# Altium schematic sheet Connector Section.SchDoc
size A4; DocumentNumber: 6; SheetNumber: 6; SheetTotal: 6
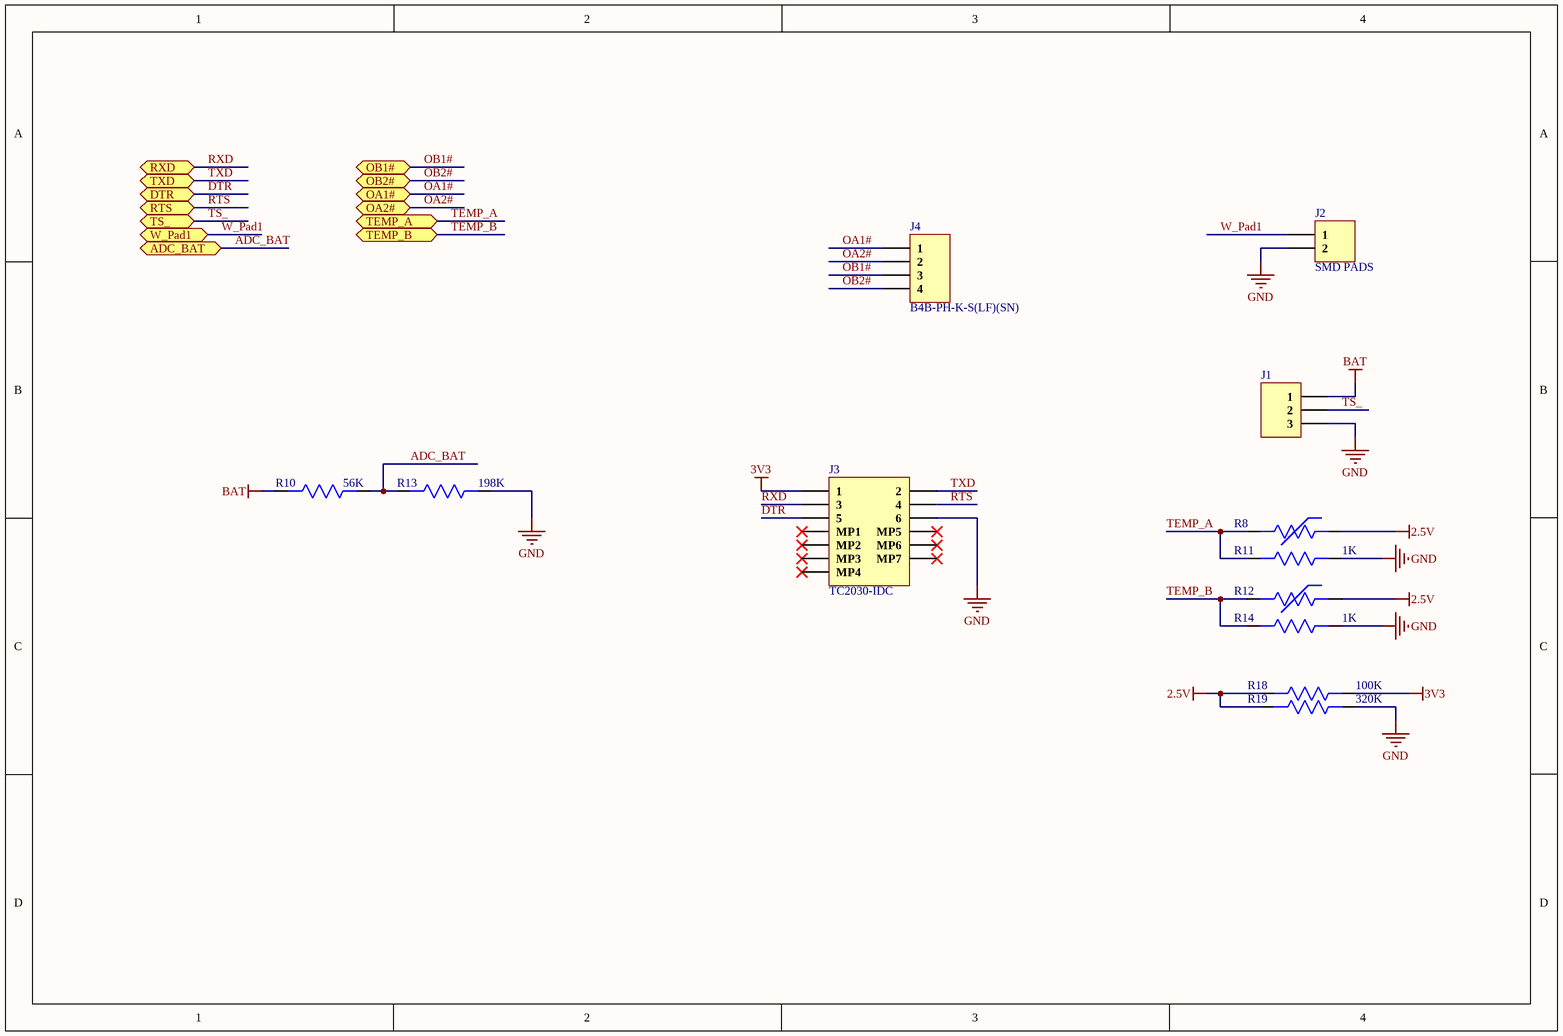
[diagram p0: Connector Section.SchDoc]

## Parts
J1  B3B-PH-K-S(LF)(SN)  [B3B-PH-K-S(LF)(SN)]  (value not drawn)
J2  SMD PADS  [SMD PAD]
J3  TC2030-IDC  [TC2030-IDC]
J4  B4B-PH-K-S(LF)(SN)  [B4B-PH-K-S(LF)(SN)]
R8  B57230V2103F260  [Res0402]  (value not drawn)
R10  56K  [Res-0201]
R11  1K  [Res-0201]
R12  B57230V2103F260  [Res0402]  (value not drawn)
R13  198K  [Res0402]
R14  1K  [Res-0201]
R18  100K  [Res-0201]
R19  320K  [Res0603]

## Ports
ADC_BAT (bidir), DTR (bidir), OA1# (bidir), OA2# (bidir), OB1# (bidir), OB2# (bidir), RTS (bidir), RXD (bidir), TEMP_A (bidir), TEMP_B (bidir), TS_ (bidir), TXD (bidir), W_Pad1 (bidir)

## Nets
2.5V: R8.1 R12.1 R18.2 R19.2
3V3: J3.1 R18.1
BAT: J1.1 R10.2
GND: J1.3 J2.2 J3.6 R11.1 R13.1 R14.1 R19.1
ADC_BAT: R10.1 R13.2 ; port ADC_BAT
DTR: J3.5 ; port DTR
OA1#: J4.1 ; port OA1#
OA2#: J4.2 ; port OA2#
OB1#: J4.3 ; port OB1#
OB2#: J4.4 ; port OB2#
RTS: J3.4 ; port RTS
RXD: J3.3 ; port RXD
TEMP_A: R8.2 R11.2 ; port TEMP_A
TEMP_B: R12.2 R14.2 ; port TEMP_B
TS_: J1.2 ; port TS_
TXD: J3.2 ; port TXD
W_Pad1: J2.1 ; port W_Pad1

Not connected (* = marked no-connect by the designer): J3 MP1* MP2* MP3* MP4* MP5* MP6* MP7*

## Library data of the parts
J1 = B3B-PH-K-S(LF)(SN): CONN HEADER VERT 3POS 2MM; Manufacturer: JST; Number of Positions: 3; Connector Type: Male Pin; Current Rating: 2A; Contact Resistance: 20mR; Voltage Rating (AC): 100V; Insulation Resistance: 1MR; Gender: Male; Supplier 1: Future Electronics; Manufacturer Part Number: B3B-PH-K-S(LF)(SN); RoHS: Yes; Category: Headers and Wire Housings; Pricing 1: 1=0.07800, 500=0.06750, 1500=0.06580, 5000=0.06400, 15000=0.06240 (USD); Mount: Through Hole; Number of Pins: 3; Contact Plating: Tin,Copper; Color: Natural; Contact Material: Brass,Tin; Housing Color: White; Housing Material: Polyamide; Min Operating Temperature: -25°C; Max Operating Temperature: 85°C; Number of Rows: 1; Packaging: Bulk; Max Current Rating: 2A; Number of Poles: 3; Voltage Rating: 100V; Termination: Solder; Fastening Type: Detent; Number of Contacts: 3; Max Voltage Rating (AC): 100V; Max Voltage Rating (DC): 100V; Working Voltage: 100V; Orientation: Straight; Length: 7.9mm; Width: 4.5mm; Height: 9.4mm; Pitch: 2mm; Lead Pitch: 2mm; Contact Mating Length: 0.13inch; Depth: 4.5mm; Lead Free: Lead Free; REACH SVHC: No SVHC; ComponentLink1URL: https://datasheet.ciiva.com/6747/80560-6747401.pdf?src-supplier=Newark; ComponentLink1Description: https://datasheet.ciiva.com/6747/80560-6747401.pdf?src-supplier=Newark; ComponentLink2URL: https://datasheet.ciiva.com/11746/0900766b80826550-11746939.pdf?src-supplier=RSComponents; ComponentLink2Description: https://datasheet.ciiva.com/11746/0900766b80826550-11746939.pdf?src-supplier=RSComponents; ComponentLink3URL: https://datasheet.ciiva.com/26894/getdatasheetpartid-448114-26894774.pdf?src-supplier=Verical; ComponentLink3Description: https://datasheet.ciiva.com/26894/getdatasheetpartid-448114-26894774.pdf?src-supplier=Verical; ComponentLink4URL: https://datasheet.ciiva.com/712/eph-712455.pdf?src-supplier=Digi-Key; ComponentLink4Description: https://datasheet.ciiva.com/712/eph-712455.pdf?src-supplier=Digi-Key; ComponentLink5URL: https://datasheet.ciiva.com/26924/getdatasheetpartid-651387-26924028.pdf?src-supplier=Verical; ComponentLink5Description: https://datasheet.ciiva.com/26924/getdatasheetpartid-651387-26924028.pdf?src-supplier=Verical; ComponentLink6URL: https://datasheet.ciiva.com/16200/eph-16200926.pdf?src-supplier=Future+Electronics; ComponentLink6Description: https://datasheet.ciiva.com/16200/eph-16200926.pdf?src-supplier=Future+Electronics; ComponentLink7URL: https://datasheet.ciiva.com/43491/741202-da-01-en-stiftleiste-gerade-3-pol-rm2-0-43491962.pdf?src-supplier=Conrad; ComponentLink7Description: https://datasheet.ciiva.com/43491/741202-da-01-en-stiftleiste-gerade-3-pol-rm2-0-43491962.pdf?src-supplier=Conrad; Supplier Part Number 1: 6478077
J2 = SMD PAD
J3 = TC2030-IDC: CABLE ADAPTER 6 POS; Manufacturer: Tag-Connect; ComponentLink1URL: http://www.tag-connect.com/Materials/TC2030-MCP%20Datasheet.pdf?src-supplier=Digi-Key; ComponentLink1Description: http://www.tag-connect.com/Materials/TC2030-MCP%20Datasheet.pdf?src-supplier=Digi-Key; Supplier 1: Digi-Key; Manufacturer Part Number: TC2030-IDC; Stock 1: 284; Pricing 1: 1=43.71 (USD); Package Quantity: 1; Supplier Part Number 1: TC2030-IDC-ND
J4 = B4B-PH-K-S(LF)(SN): CONN HEADER VERT 4POS 2MM; Manufacturer: JST; Current Rating: 2A; Voltage Rating: 100V; Contact Resistance: 20mR; Number of Poles: 4; Insulation Resistance: 1MR; Gender: Male; Connector Type: Male Pin; Supplier 1: Newark; Manufacturer Part Number: B4B-PH-K-S(LF)(SN); RoHS: Yes; Category: Connectors; Mount: Through Hole; Number of Pins: 4; Contact Material: Brass,Tin; Contact Plating: Tin,Copper; Color: Natural; Housing Color: White; Housing Material: Polyamide; Material: Polyamide; Min Operating Temperature: -25°C; Max Operating Temperature: 85°C; Number of Rows: 1; Max Current Rating: 2A; Voltage Rating (AC): 100V; Packaging: Bulk; Number of Positions: 4; Termination: Solder; Fastening Type: Detent; Number of Contacts: 4; Max Voltage Rating (AC): 100V; Max Voltage Rating (DC): 100V; Working Voltage: 100V; Orientation: Straight; Length: 9.9mm; Width: 4.5mm; Height: 9.4mm; Pitch: 2mm; Lead Pitch: 2mm; Contact Mating Length: 0.13inch; Depth: 4.5mm; REACH SVHC: No SVHC; Lead Free: Lead Free; ComponentLink1URL: https://datasheet.ciiva.com/11747/0900766b8082f552-11747200.pdf?src-supplier=RSComponents; ComponentLink1Description: https://datasheet.ciiva.com/11747/0900766b8082f552-11747200.pdf?src-supplier=RSComponents; ComponentLink2URL: https://datasheet.ciiva.com/712/eph-712488.pdf?src-supplier=Digi-Key; ComponentLink2Description: https://datasheet.ciiva.com/712/eph-712488.pdf?src-supplier=Digi-Key; ComponentLink3URL: https://datasheet.ciiva.com/16209/eph-16209245.pdf?src-supplier=Future+Electronics; ComponentLink3Description: https://datasheet.ciiva.com/16209/eph-16209245.pdf?src-supplier=Future+Electronics; ComponentLink4URL: https://datasheet.ciiva.com/43491/741223-da-01-en-stiftleiste-gerade-4-pol-rm2-0-43491964.pdf?src-supplier=Conrad; ComponentLink4Description: https://datasheet.ciiva.com/43491/741223-da-01-en-stiftleiste-gerade-4-pol-rm2-0-43491964.pdf?src-supplier=Conrad; Supplier Part Number 1: 37K9958
R8 R12 = B57230V2103F260: THERMISTOR NTC 10KOHM 3380K 0402; Manufacturer: TDK EPCOS; Tolerance: 1%; Resistance: 10kR; Power Rating: 150mW; Supplier 1: Digi-Key; Manufacturer Part Number: B57230V2103F260; RoHS: Yes; Category: Thermistors; Stock 1: 17040; Pricing 1: 1=0.12000, 5=0.11400, 10=0.10200, 25=0.09360, 50=0.07500, 100=0.06430, 500=0.05628, 1000=0.04824, 5000=0.04288 (USD); Mount: Surface Mount; Case/Package: 0402; Number of Pins: 2; Case Code (Metric): 1005; Case Code (Imperial): 0402; Contact Plating: Tin; Min Operating Temperature: -55°C; Max Operating Temperature: 125°C; Package Quantity: 10000; Packaging: Tape and Reel; Max Power Dissipation: 150mW; Termination: SMD/SMT; Series: -; Resistance Tolerance: 1%; Length: 1mm; Width: 0.8mm; Height: 0.9mm; Depth: 0.5mm; REACH SVHC: No SVHC; RoHS Compliant: Yes; ComponentLink1URL: https://datasheet.ciiva.com/29706/ntc-smd-standard-series-0402-29706167.pdf?src-supplier=Digi-Key; ComponentLink1Description: https://datasheet.ciiva.com/29706/ntc-smd-standard-series-0402-29706167.pdf?src-supplier=Digi-Key; ComponentLink2URL: https://datasheet.ciiva.com/29706/ntc-smd-standard-series-0402-29706168.pdf?src-supplier=Digi-Key; ComponentLink2Description: https://datasheet.ciiva.com/29706/ntc-smd-standard-series-0402-29706168.pdf?src-supplier=Digi-Key; ComponentLink3URL: https://datasheet.ciiva.com/46409/1835848-46409416.pdf?src-supplier=Element14; ComponentLink3Description: https://datasheet.ciiva.com/46409/1835848-46409416.pdf?src-supplier=Element14; ComponentLink4URL: https://datasheet.ciiva.com/29706/ntc-smd-standard-series-0402-29706169.pdf?src-supplier=Digi-Key; ComponentLink4Description: https://datasheet.ciiva.com/29706/ntc-smd-standard-series-0402-29706169.pdf?src-supplier=Digi-Key; ComponentLink5URL: https://datasheet.ciiva.com/46409/1835848-46409417.pdf?src-supplier=Element14; ComponentLink5Description: https://datasheet.ciiva.com/46409/1835848-46409417.pdf?src-supplier=Element14; Supplier Part Number 1: 495-5814-1-ND
R10 = AC0201FR-0756KL: RES SMD 56K OHM 1% 1/20W 0201; Manufacturer: Yageo; Resistance: 56kR; Temperature Coefficient: 200ppm/°C; Max Power Dissipation: 50mW; ComponentLink1URL: http://www.yageo.com/NewPortal/yageodocoutput?fileName=/pdf/R-Chip/PYu-AC_51_RoHS_L_5.pdf&src-supplier=Digi-Key; ComponentLink1Description: http://www.yageo.com/NewPortal/yageodocoutput?fileName=/pdf/R-Chip/PYu-AC_51_RoHS_L_5.pdf&src-supplier=Digi-Key; ComponentLink2URL: http://www.yageo.com/NewPortal/yageodocoutput?fileName=/pdf/R-Chip/PYu-AC_51_RoHS_L_6.pdf&src-supplier=Digi-Key; ComponentLink2Description: http://www.yageo.com/NewPortal/yageodocoutput?fileName=/pdf/R-Chip/PYu-AC_51_RoHS_L_6.pdf&src-supplier=Digi-Key; Supplier 1: Digi-Key; Manufacturer Part Number: AC0201FR-0756KL; Stock 1: 23567; Pricing 1: 1=0.10000, 10=0.05700, 100=0.02320, 1000=0.01044, 2500=0.00906, 5000=0.00749 (USD); Case/Package: 0201; Min Operating Temperature: -55°C; Max Operating Temperature: 155°C; Tolerance: 1%; Packaging: Tape and Reel; Features: Moisture Resistant,Automotive AEC-Q200; Resistor Type: Thick Film; Number of Terminations: 2; Length: 0.024inch; Width: 0.012inch; Height: 0.01inch; RoHS Compliant: Yes; Supplier Part Number 1: YAG5226CT-ND; RoHS: Yes; Category: Chip SMD Resistors
R11 R14 = RC0201FR-071KP: RES 1K OHM 1% 1/20W 0201; Manufacturer: Yageo; Supplier 1: Digi-Key; Manufacturer Part Number: RC0201FR-071KP; RoHS: Yes; Stock 1: 4800; Pricing 1: 1=0.11000, 10=0.10200, 100=0.03940, 1000=0.01734, 2500=0.01497, 5000=0.01340 (USD); RoHS Compliant: Yes; Supplier Part Number 1: 13-RC0201FR-071KPCT-ND
R13 = RN73H1ETTP1983D25: RES 198K OHM 0.5% 1/16W 0402; Manufacturer: KOA Speer; Resistance: 198kR; Power Rating: 63mW; Voltage Rating: 50V; Temperature Coefficient: 25ppm/°C; ComponentLink1URL: http://www.yageo.com/documents/recent/PYu-RC_Group_51_RoHS_L_9.pdf?src-supplier=Digi-Key; ComponentLink1Description: http://www.yageo.com/documents/recent/PYu-RC_Group_51_RoHS_L_9.pdf?src-supplier=Digi-Key; ComponentLink2URL: http://www.yageo.com.tw/exep/pages/download/literatures/PYu-R_INT-thick_7.pdf?src-supplier=Digi-Key; ComponentLink2Description: http://www.yageo.com.tw/exep/pages/download/literatures/PYu-R_INT-thick_7.pdf?src-supplier=Digi-Key; Supplier 1: Digi-Key; Manufacturer Part Number: RN73H1ETTP1983D25; Stock 1: 0; Pricing 1: 1000=0.0784 (USD); Case/Package: 0402; Case Code (Imperial): 0402; Case Code (Metric): 1005; Min Operating Temperature: -55°C; Max Operating Temperature: 155°C; Tolerance: 0.5%; Packaging: Tape and Reel; Package Quantity: 10000; RoHS Compliant: Yes; ComponentLink3URL: http://www.koaspeer.com/products/resistors/surface-mount-resistors/rn73h/?src-supplier=Mouser; ComponentLink3Description: http://www.koaspeer.com/products/resistors/surface-mount-resistors/rn73h/?src-supplier=Mouser; Supplier Part Number 1: 2019-RN73H1ETTP1983D25CT-ND
R18 = RC0201FR-07100KL: RES SMD 100K OHM 1% 1/20W 0201; Manufacturer: Yageo; Resistance: 100kR; Power Rating: 50mW; Voltage Rating: 25V; Temperature Coefficient: 200ppm/°C; ComponentLink1URL: http://www.yageo.com/documents/recent/PYu-RC_Group_51_RoHS_L_9.pdf?src-supplier=Digi-Key; ComponentLink1Description: http://www.yageo.com/documents/recent/PYu-RC_Group_51_RoHS_L_9.pdf?src-supplier=Digi-Key; ComponentLink2URL: http://www.yageo.com.tw/exep/pages/download/literatures/PYu-R_INT-thick_7.pdf?src-supplier=Digi-Key; ComponentLink2Description: http://www.yageo.com.tw/exep/pages/download/literatures/PYu-R_INT-thick_7.pdf?src-supplier=Digi-Key; Supplier 1: Digi-Key; Manufacturer Part Number: RC0201FR-07100KL; Stock 1: 2817321; Pricing 1: 1=0.1, 10=0.036, 100=0.0148, 1000=0.0067, 2500=0.0058, 5000=0.0048 (USD); Case/Package: 0201; Number of Pins: 2; Case Code (Imperial): 0201; Case Code (Metric): 0603; Contact Plating: Tin,Matte; Size Code: 0201; Min Operating Temperature: -55°C; Max Operating Temperature: 125°C; Tolerance: 1%; Packaging: Tape and Reel; Package Quantity: 10000; Termination: SMD/SMT; Resistor Type: Thick Film; Number of Terminations: 2; Max Power Dissipation: 50mW; Voltage Rating (DC): 25V; Features: Moisture Resistant; Series: RC; Resistance Tolerance: 1%; Construction: Rectangular; Length: 0.024inch; Width: 0.012inch; Height: 0.01inch; Depth: 0.3mm; REACH SVHC: No SVHC; Military Standard: Not; Lead Free: Lead Free; RoHS Compliant: Yes; ComponentLink3URL: http://www.farnell.com/datasheets/2167052.pdf?src-supplier=Element14; ComponentLink3Description: http://www.farnell.com/datasheets/2167052.pdf?src-supplier=Element14; ComponentLink4URL: http://www.yageo.com/documents/recent/PYu-RC_Group_51_RoHS_L_10.pdf?src-supplier=Digi-Key; ComponentLink4Description: http://www.yageo.com/documents/recent/PYu-RC_Group_51_RoHS_L_10.pdf?src-supplier=Digi-Key; ComponentLink5URL: https://www.verical.com/server-webapp/html/getDatasheet?partID=420441&src-supplier=Verical; ComponentLink5Description: https://www.verical.com/server-webapp/html/getDatasheet?partID=420441&src-supplier=Verical; ComponentLink6URL: http://www.farnell.com/datasheets/1421516.pdf?src-supplier=Element14; ComponentLink6Description: http://www.farnell.com/datasheets/1421516.pdf?src-supplier=Element14; ComponentLink7URL: http://www.yageo.com/documents/recent/PYu-RC0201_51_RoHS_L_8.pdf?src-supplier=Avnet+Europe; ComponentLink7Description: http://www.yageo.com/documents/recent/PYu-RC0201_51_RoHS_L_8.pdf?src-supplier=Avnet+Europe; Supplier Part Number 1: 311-100KMCT-ND
R19 = RN73H1JTTD3203C25: RES 320K OHM 0.25% 1/10W 0603